# EAGLE design BDC-REV2 (EAGLE 9.6.2)
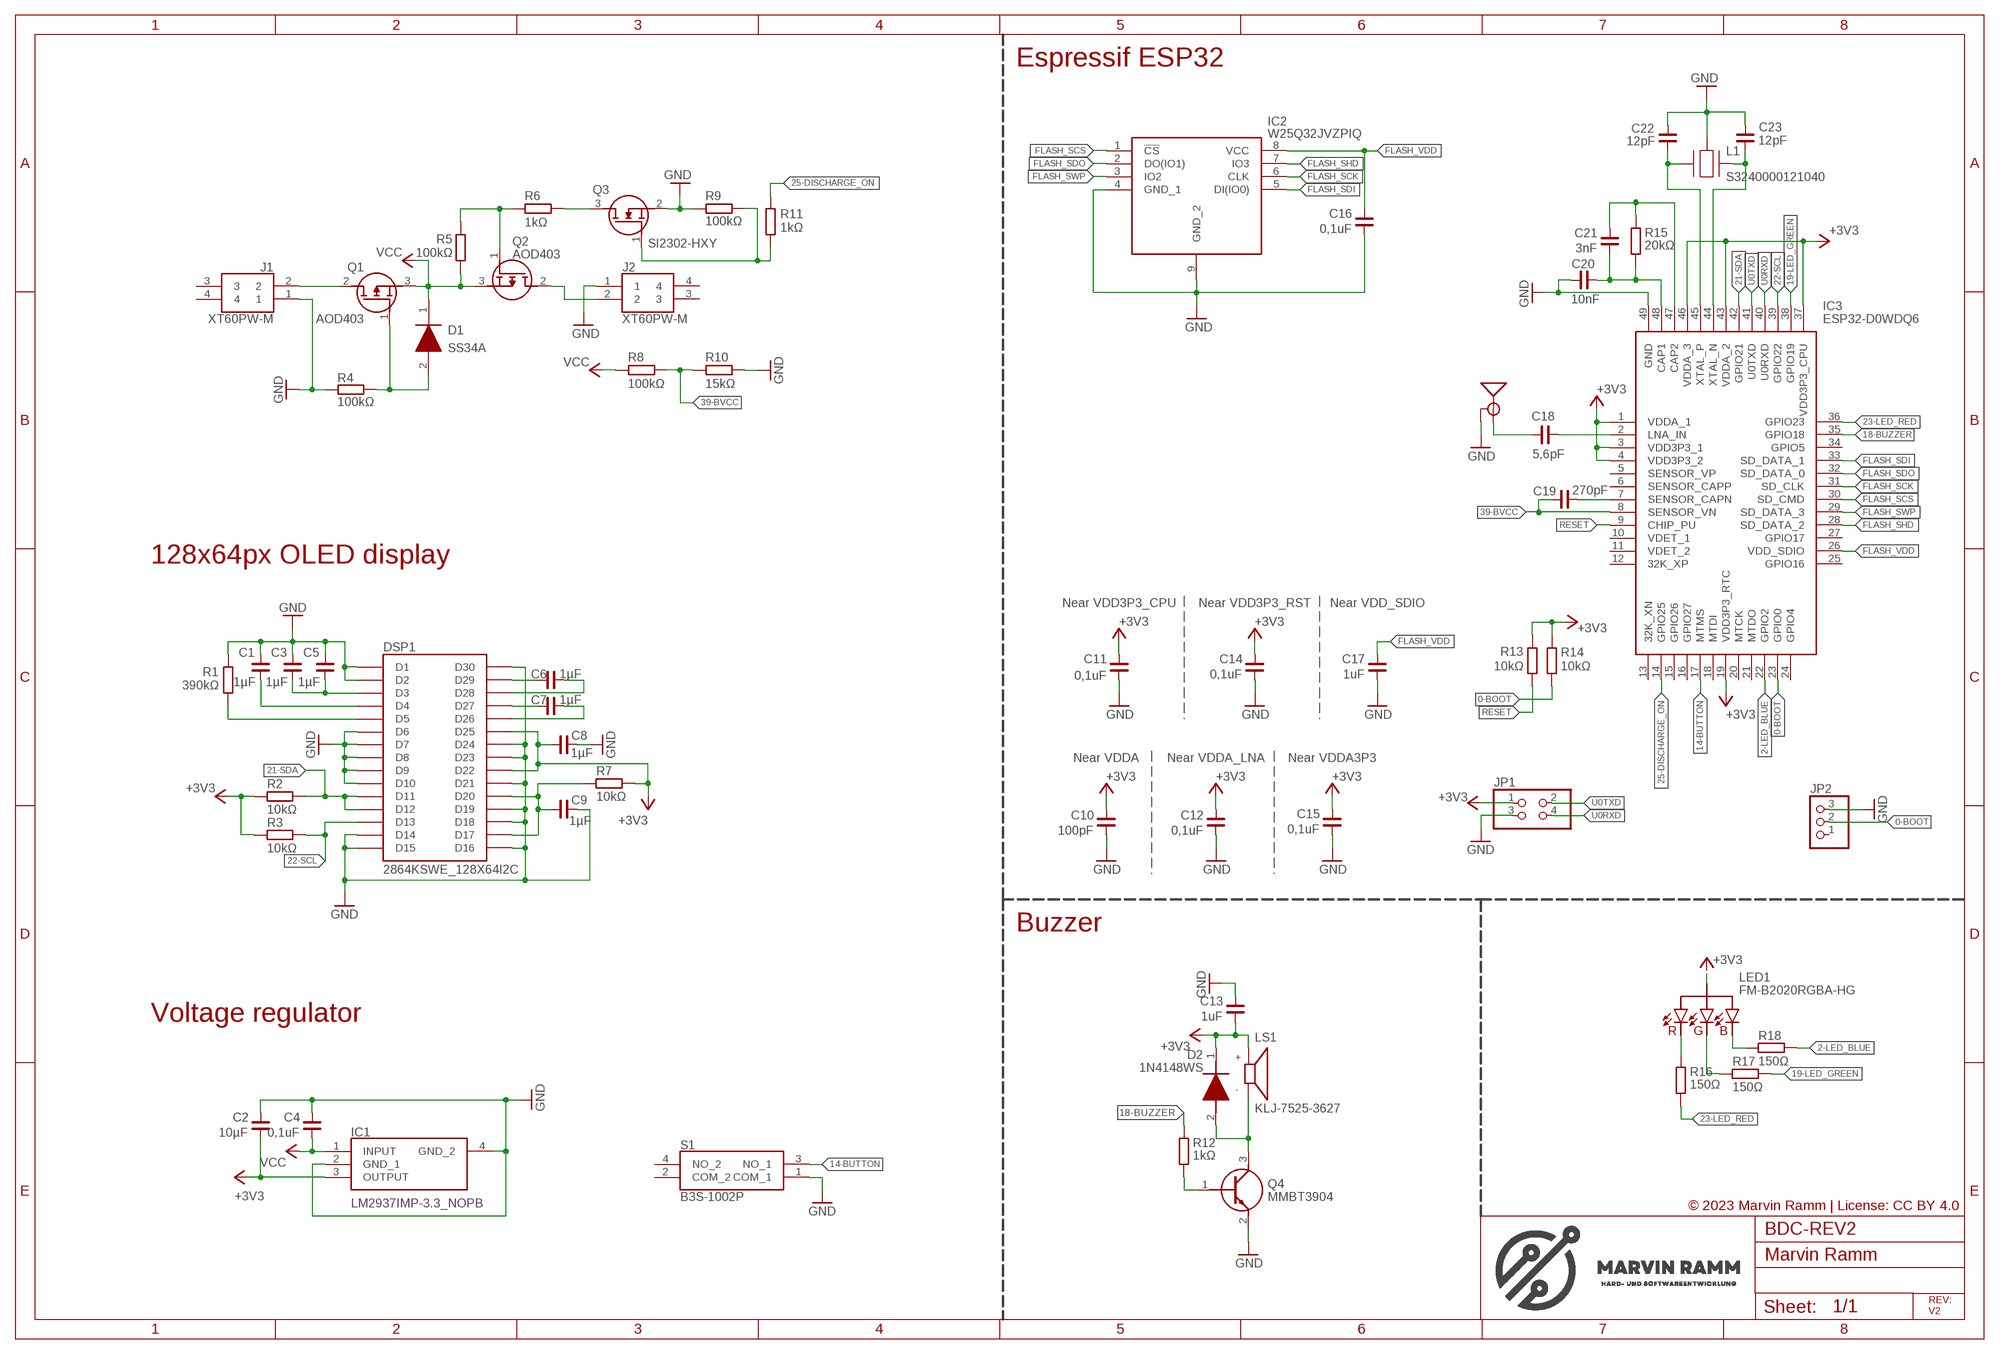
[diagram p0: schematic, sheet 1]

## Parts
C1  1µF  C_0402  [C0402]
C2  10µF  C_0603  [C0603]
C3  1µF  C_0402  [C0402]
C4  0,1uF  C_0402  [C0402]
C5  1µF  C_0402  [C0402]
C6  1µF  C_0402  [C0402]
C7  1µF  C_0402  [C0402]
C8  1µF  C_0402  [C0402]
C9  1µF  C_0402  [C0402]
C10  100pF  C_0402  [C0402]
C11  0,1uF  C_0402  [C0402]
C12  0,1uF  C_0402  [C0402]
C13  1uF  C_0402  [C0402]
C14  0,1uF  C_0402  [C0402]
C15  0,1uF  C_0402  [C0402]
C16  0,1uF  C_0402  [C0402]
C17  1uF  C_0402  [C0402]
C18  5,6pF  C_0402  [C0402]
C19  270pF  C_0402  [C0402]
C20  10nF  C_0402  [C0402]
C21  3nF  C_0402  [C0402]
C22  12pF  C_0402  [C0402]
C23  12pF  C_0402  [C0402]
D1  SS34A  [DIOM5026X262N]
D2  1N4148WS  [SODFL2512X90N]
DSP1  2864KSWE_128X64I2C  [2864KSWE_128X64I2C]
E1  ANTENNA-GROUNDEDTRACE-15.2MM  [TRACE_ANTENNA_2.4GHZ_15.2MM]
IC1  LM2937IMP-3.3_NOPB  [SOT230P700X180-4N]
IC2  W25Q128JVPIQ  [SON127P800X600X80-9N]
IC3  ESP32-D0WDQ6  [QFN40P600X600X90-49N]
J1  XT60PW-M  [XT60PWM]
J2  XT60PW-M  [XT60PWM]
JP1  PINHD-2X2  [2X02]
JP2  PINHD-1X3  [1X03]
L1  SMD-3225_4P16MHZ_20PF_10PPM_-4  [SMD3225_4P16MHZ20PF10PPM4085]
LED1  FM-B2020RGBA-HG  [FMB2020RGBAHG]
LS1  CMT-7525-80-SMT-TR  [XDCR_CMT-7525-80-SMT-TR]
Q1  AOD403  [AOD480]
Q2  AOD403  [AOD480]
Q3  SI2302DDS-T1-GE3  [SOT95P237X112-3N]
Q4  MMBT3904  [SOT95P240X120-3N]
R1  390kΩ  R_0402  [R0402]
R2  10kΩ  R_0402  [R0402]
R3  10kΩ  R_0402  [R0402]
R4  100kΩ  R_0402  [R0402]
R5  100kΩ  R_0402  [R0402]
R6  1kΩ  R_0402  [R0402]
R7  10kΩ  R_0402  [R0402]
R8  100kΩ  R_0402  [R0402]
R9  100kΩ  R_0402  [R0402]
R10  15kΩ  R_0402  [R0402]
R11  1kΩ  R_0402  [R0402]
R12  1kΩ  R_0402  [R0402]
R13  10kΩ  R_0402  [R0402]
R14  10kΩ  R_0402  [R0402]
R15  20kΩ  R_0402  [R0402]
R16  150Ω  R_0402  [R0402]
R17  150Ω  R_0402  [R0402]
R18  150Ω  R_0402  [R0402]
S1  B3S-1002P  [B3S1002P]

## Nets
0-BOOT: IC3.23(GPIO0) JP2.2 R14.2
2-LED_BLUE: IC3.22(GPIO2) R18.2
14-BUTTON: IC3.17(MTMS) S1.3(NO_1)
18-BUZZER: IC3.35(GPIO18) R12.1
19-LED_GREEN: IC3.38(GPIO19) R17.2
21-SDA: DSP1.D11 DSP1.D12 IC3.42(GPIO21) R2.2
22-SCL: DSP1.D13 IC3.39(GPIO22) R3.2
23-LED_RED: IC3.36(GPIO23) R16.2
25-DISCHARGE_ON: IC3.14(GPIO25) R11.1
39-BVCC: C19.1 IC3.8(SENSOR_VN) R8.1 R10.2
+3V3: C2.2 C8.1 C10.2 C11.2 C12.2 C13.1 C14.2 C15.2 D2.1(K) DSP1.D22 DSP1.D25 IC1.3(OUTPUT) IC3.1(VDDA_1) IC3.3(VDD3P3_1) IC3.4(VDD3P3_2) IC3.19(VDD3P3_RTC) IC3.37(VDD3P3_CPU) IC3.43(VDDA_2) IC3.46(VDDA_3) JP1.1 LED1.3(VCC) LS1.P R2.1 R3.1 R7.2 R13.2 R14.1
FLASH_SCK: IC2.6(CLK) IC3.31(SD_CLK)
FLASH_SCS: IC2.1(!CS) IC3.30(SD_CMD)
FLASH_SDI: IC2.5(DI(IO0)) IC3.33(SD_DATA_1)
FLASH_SDO: IC2.2(DO(IO1)) IC3.32(SD_DATA_0)
FLASH_SHD: IC2.7(IO3) IC3.28(SD_DATA_2)
FLASH_SWP: IC2.3(IO2) IC3.29(SD_DATA_3)
FLASH_VDD: C16.2 C17.2 IC2.8(VCC) IC3.26(VDD_SDIO)
GND: C1.1 C2.1 C3.1 C4.2 C5.1 C8.2 C9.2 C10.1 C11.1 C12.1 C13.2 C14.1 C15.1 C16.1 C17.1 C20.1 C22.1 C23.1 DSP1.D1 DSP1.D2 DSP1.D6 DSP1.D7 DSP1.D8 DSP1.D9 DSP1.D10 DSP1.D14 DSP1.D15 DSP1.D16 DSP1.D18 DSP1.D19 DSP1.D21 DSP1.D23 DSP1.D24 DSP1.D30 E1.GND IC1.2(GND_1) IC1.4(GND_2) IC2.4(GND_1) IC2.9(GND_2) IC3.49(GND) J1.1 J2.1 JP1.3 JP2.3 L1.2(GND_2) L1.4(GND_2) Q3.2(S) Q4.2(E) R1.2 R4.1 R9.2 R10.1 S1.1(COM_1)
N$1: C18.2 E1.ANT(SIGNAL)
N$2: Q2.1(G) R5.2 R6.2
N$3: J2.2 Q2.2(D)
N$5: Q3.3(D) R6.1
N$6: Q3.1(G) R9.1 R11.2
N$7: LED1.1(R) R16.1
N$8: LED1.2(B) R18.1
N$9: LED1.4(G) R17.1
N$10: J1.2 Q1.2(D)
N$15: D1.2(A) Q1.1(G) R4.2
N$23: C18.1 IC3.2(LNA_IN)
N$24: C20.2 C21.1 IC3.48(CAP1) R15.2
N$25: C21.2 IC3.47(CAP2) R15.1
N$26: C23.2 IC3.44(XTAL_N) L1.3(CRYSTAL_2)
N$27: C22.2 IC3.45(XTAL_P) L1.1(CRYSTAL_1)
N$28: C7.1 DSP1.D27
N$30: C9.1 DSP1.D17 DSP1.D20 R7.1
N$31: C1.2 DSP1.D4
N$32: C7.2 DSP1.D26
N$33: C3.2 C5.2 DSP1.D3
N$34: DSP1.D5 R1.1
N$35: C6.1 DSP1.D29
N$36: C6.2 DSP1.D28
N$39: C19.2 IC3.7(SENSOR_CAPN)
N$66: D2.2(A) LS1.N Q4.3(C)
N$69: Q4.1(B) R12.2
RESET: IC3.9(CHIP_PU) R13.1
U0RXD: IC3.40(U0RXD) JP1.4
U0TXD: IC3.41(U0TXD) JP1.2
VCC: C4.1 D1.1(K) IC1.1(INPUT) Q1.3(S) Q2.3(S) R5.1 R8.2
Unconnected: IC3.5(SENSOR_VP) IC3.6(SENSOR_CAPP) IC3.10(VDET_1) IC3.11(VDET_2) IC3.12(32K_XP) IC3.13(32K_XN) IC3.15(GPIO26) IC3.16(GPIO27) IC3.18(MTDI) IC3.20(MTCK) IC3.21(MTDO) IC3.24(GPIO4) IC3.25(GPIO16) IC3.27(GPIO17) IC3.34(GPIO5) J1.3 J1.4 J2.3 J2.4 JP2.1 S1.2(COM_2) S1.4(NO_2)

## Notes on the sheet
- Espressif ESP32
- W25Q32JVZPIQ
- S3240000121040
- SI2302-HXY
- 128x64px OLED display
- Near VDD3P3_CPU | Near VDD3P3_RST | Near VDD_SDIO
- Near VDDA | Near VDDA_LNA | Near VDDA3P3
- Buzzer
- Voltage regulator
- KLJ-7525-3627
- © 2023 Marvin Ramm | License: CC BY 4.0
- Marvin Ramm
- REV:
  V2

## Library data of the parts
C1-C23 = rc-master-smd:C_: NON-POLARIZED CAP
D1 = SS34A:SS34A: MULTICOMP - SS34A - DIODE, RECTIFIER, 3A, 40V, DO-214AC Source: Datasheet <https://componentsearchengine.com/Datasheets/2/SS34A.pdf>; DESCRIPTION: MULTICOMP - SS34A - DIODE, RECTIFIER, 3A, 40V, DO-214AC; HEIGHT: 2.62mm; MANUFACTURER_NAME: MULTICOMP; MANUFACTURER_PART_NUMBER: SS34A
D2 = 1N4148WS:1N4148WS: ON Semiconductor Switching Diode, 300mA 75V, 2-Pin SOD-323 1N4148WS Source: Datasheet; ARROW_PART_NUMBER: 1N4148WS; ARROW_PRICE-STOCK: https://www.arrow.com/en/products/1n4148ws/on-semiconductor?region=asia; DESCRIPTION: ON Semiconductor Switching Diode, 300mA 75V, 2-Pin SOD-323 1N4148WS; HEIGHT: 0.9mm; MANUFACTURER_NAME: onsemi; MANUFACTURER_PART_NUMBER: 1N4148WS; MOUSER_PART_NUMBER: 512-1N4148WS; MOUSER_PRICE-STOCK: https://www.mouser.co.uk/ProductDetail/ON-Semiconductor-Fairchild/1N4148WS?qs=2%2FYqgE%252BHg%252BKBrKZlAsMLhw%3D%3D
DSP1 = 2864KSWE_128X64I2C:2864KSWE_128X64I2C
E1 = SparkFun-RF:ANTENNA-GROUNDED: Antenna w/ Ground Connection 2.4GHz antennae with signal and ground terminals. TRACE_ANTENNA_2.4GHZ_15.2MM - Meander Trace antenna 15.2 x 5.7mm footprint Based on layout from TI app note AN043 <http://www.ti.com/lit/an/swra117d/swra117d.pdf>. TRACE_ANTENNA_2.4GHZ_25.7MM - Inverted F trace antenna 25.7 x 7.5 mm footprint. Based on layout from TI design note DN0007 <http://www.ti.com/lit/an/swru120b/swru120b.pdf>.
IC1 = LM2937IMP-3.3_NOPB:LM2937IMP-3.3_NOPB: LM2937 2.5-V and 3.3-V 400-mA and 500-mA Voltage Regulators Source: Datasheet <https://www.ti.com/lit/ds/symlink/lm2937.pdf?ts=1607582693087&ref_url=https%3A%2F%2Fwww.ti.com%2Fsitesearch%2Fdocs%2Funiversalsearch.tsp%3FsearchTerm%3DLM2937IMP-3.3%2FNOPB>; ARROW_PART_NUMBER: LM2937IMP-3.3/NOPB; ARROW_PRICE-STOCK: https://www.arrow.com/en/products/lm2937imp-3.3nopb/texas-instruments?region=nac; DESCRIPTION: LM2937 2.5-V and 3.3-V 400-mA and 500-mA Voltage Regulators; HEIGHT: 1.8mm; MANUFACTURER_NAME: Texas Instruments; MANUFACTURER_PART_NUMBER: LM2937IMP-3.3/NOPB; MOUSER_PART_NUMBER: 926-LM2937IMP3.3NOPB; MOUSER_PRICE-STOCK: https://www.mouser.co.uk/ProductDetail/Texas-Instruments/LM2937IMP-3.3-NOPB?qs=X1J7HmVL2ZFVwNOBcwuxRQ%3D%3D
IC2 = W25Q128JVPIQ:W25Q128JVPIQ: IC FLASH 128M SPI 133MHZ 8WSON Source: Datasheet <https://www.arrow.com/en/products/w25q128jvpiq/winbond-electronics>; ARROW_PART_NUMBER: W25Q128JVPIQ; ARROW_PRICE-STOCK: https://www.arrow.com/en/products/w25q128jvpiq/winbond-electronics?region=nac; DESCRIPTION: IC FLASH 128M SPI 133MHZ 8WSON; HEIGHT: 0.8mm; MANUFACTURER_NAME: Winbond; MANUFACTURER_PART_NUMBER: W25Q128JVPIQ; MOUSER_PART_NUMBER: 454-W25Q128JVPIQ; MOUSER_PRICE-STOCK: https://www.mouser.co.uk/ProductDetail/Winbond/W25Q128JVPIQ?qs=qSfuJ%252Bfl%2Fd676hAD%252B1JSfw%3D%3D
IC3 = ESP32-D0WDQ6:ESP32-D0WDQ6: RF System on a Chip - SoC SMD IC ESP32-D0WDQ6, Dual Core MCU, WiFi & Bluetooth Combo, QFN48-pin, 6*6mm Source: Datasheet <https://www.espressif.com/sites/default/files/documentation/esp32_datasheet_en.pdf>; DESCRIPTION: RF System on a Chip - SoC SMD IC ESP32-D0WDQ6, Dual Core MCU, WiFi & Bluetooth Combo, QFN48-pin, 6*6mm; HEIGHT: 0.9mm; MANUFACTURER_NAME: Espressif Systems; MANUFACTURER_PART_NUMBER: ESP32-D0WDQ6; MOUSER_PART_NUMBER: 356-ESP32-D0WDQ6; MOUSER_PRICE-STOCK: https://www.mouser.co.uk/ProductDetail/Espressif-Systems/ESP32-D0WDQ6?qs=chTDxNqvsykWgzfXx0gR%252BQ%3D%3D
J1 J2 = XT60PW-M:XT60PW-M: Socket; DC supply; XT60; male; PIN: 2; on PCBs; THT; Colour: yellow Source: Datasheet <https://www.tme.eu/Document/9b8d0c5eb7094295f3d3112c214d3ade/XT60PW SPEC.pdf>; DESCRIPTION: Socket; DC supply; XT60; male; PIN: 2; on PCBs; THT; Colour: yellow; HEIGHT: 8.4mm; MANUFACTURER_NAME: Changzou Amass Elec; MANUFACTURER_PART_NUMBER: XT60PW-M; SPICEPREFIX: E
JP1 = pinhead2:PINHD-2X2: PIN HEADER
JP2 = pinhead2:PINHD-1X3: PIN HEADER
L1 = SMD-3225_4P16MHZ_20PF_10PPM_-4:SMD-3225_4P16MHZ_20PF_10PPM_-4: SMD-3225_4P16MHZ 20PF 10PPM -40~+85 Source: Datasheet <https://datasheet.lcsc.com/szlcsc/Zhejiang-Abel-Elec-SMD-3225-4P-16MHz-20pF-10ppm-40-85_C164049.pdf>; DESCRIPTION: SMD-3225_4P16MHZ 20PF 10PPM -40~+85; HEIGHT: 0.8mm; MANUFACTURER_NAME: TAE(Zhejiang Abel Elec); MANUFACTURER_PART_NUMBER: SMD-3225_4P16MHZ 20PF 10PPM -40~+85℃
LED1 = FM-B2020RGBA-HG:FM-B2020RGBA-HG: Light Emitting Diodes (LED) RGB 615~630nm Red, 515~535nm Green, 465~480nm Blue 35~85mcd@8mARed,100~260mcd@5mAGreen,15~40mcd@3mABlue Top View 2020 RoHS Source: Datasheet <https://datasheet.lcsc.com/szlcsc/Foshan-NationStar-Optoelectronics-FM-B2020RGBA-HG_C108793.pdf>
LS1 = CMT-7525-80-SMT-TR:CMT-7525-80-SMT-TR: CMT-7525-80-SMT-TR Check prices <https://pricing.snapeda.com/parts/CMT-7525-80-SMT-TR/CUI%20Devices/view-part?ref=eda>; AVAILABILITY: Good; CUI_PURCHASE_URL: https://www.cuidevices.com/product/audio/buzzers/audio-transducers/cmt-7525-80-smt-tr?utm_source=snapeda.com&utm_medium=referral&utm_campaign=snapedaBOM; DESCRIPTION: 7.5 mm, 3.6 Vo-p, 80 dB, Surface Mount (SMT), Magnetic Audio Transducer Buzzer; MF: CUI Devices; MP: CMT-7525-80-SMT-TR; PACKAGE: CUI Devices; PRICE: None; PURCHASE-URL: https://pricing.snapeda.com/search/part/CMT-7525-80-SMT-TR/?ref=eda
Q1 Q2 = AOD403:AOD403: MOSFET P-CH 30V 15A TO252 Source: Datasheet <http://aosmd.com/res/data_sheets/AOD403.pdf>; ARROW_PART_NUMBER: AOD403; ARROW_PRICE-STOCK: https://www.arrow.com/en/products/aod403/alpha-and-omega-semiconductor?region=nac; DESCRIPTION: MOSFET P-CH 30V 15A TO252; HEIGHT: 2mm; MANUFACTURER_NAME: Alpha & Omega Semiconductors; MANUFACTURER_PART_NUMBER: AOD403
Q3 = SI2302DDS-T1-GE3:SI2302DDS-T1-GE3: SI2302DDS-T1-GE3 N-Channel MOSFET, 2.6 A, 20 V, 3-Pin SOT-363 Vishay Source: Datasheet <http://www.vishay.com/docs/63653/si2302dds.pdf>; ARROW_PART_NUMBER: SI2302DDS-T1-GE3; ARROW_PRICE-STOCK: https://www.arrow.com/en/products/si2302dds-t1-ge3/vishay; DESCRIPTION: SI2302DDS-T1-GE3 N-Channel MOSFET, 2.6 A, 20 V, 3-Pin SOT-363 Vishay; HEIGHT: 1.12mm; MANUFACTURER_NAME: Vishay; MANUFACTURER_PART_NUMBER: SI2302DDS-T1-GE3; MOUSER_PART_NUMBER: 78-SI2302DDS-T1-GE3; MOUSER_PRICE-STOCK: https://www.mouser.co.uk/ProductDetail/Vishay-Semiconductors/SI2302DDS-T1-GE3?qs=MxnWX8BLHKdaCSNWhg%252BxLA%3D%3D
Q4 = MMBT3904:MMBT3904: Transistor GP BJT NPN 40V 0.2A SOT23 Fairchild MMBT3904 NPN Bipolar Transistor, 0.2 A, 40 V, 3-Pin SOT-23 Source: Datasheet <https://media.digikey.com/pdf/Data Sheets/ON Semiconductor PDFs/2N3904,MMBT3904,PZT3904.pdf>; ARROW_PART_NUMBER: MMBT3904; ARROW_PRICE-STOCK: https://www.arrow.com/en/products/mmbt3904/on-semiconductor; DESCRIPTION: Transistor GP BJT NPN 40V 0.2A SOT23 Fairchild MMBT3904 NPN Bipolar Transistor, 0.2 A, 40 V, 3-Pin SOT-23; HEIGHT: 1.2mm; MANUFACTURER_NAME: ON Semiconductor; MANUFACTURER_PART_NUMBER: MMBT3904; MOUSER_PART_NUMBER: 512-MMBT3904; MOUSER_PRICE-STOCK: https://www.mouser.co.uk/ProductDetail/ON-Semiconductor-Fairchild/MMBT3904?qs=UMEuL5FsraCg3xKjS4uBJQ%3D%3D
R1-R18 = rc-master-smd:R_: RESISTOR
S1 = B3S-1002P:B3S-1002P: OMRON ELECTRONIC COMPONENTS - B3S-1002P - SWITCH, TACTILE, SPST-NO, 50mA, SMD, FULL REEL Source: Datasheet <https://componentsearchengine.com/Datasheets/1/B3S-1002P.pdf>; ARROW_PART_NUMBER: B3S-1002P; ARROW_PRICE-STOCK: https://www.arrow.com/en/products/b3s1002p/omron; DESCRIPTION: OMRON ELECTRONIC COMPONENTS - B3S-1002P - SWITCH, TACTILE, SPST-NO, 50mA, SMD, FULL REEL; HEIGHT: 4.3mm; MANUFACTURER_NAME: Omron Electronics; MANUFACTURER_PART_NUMBER: B3S-1002P; MOUSER_PART_NUMBER: 653-B3S-1002P; MOUSER_PRICE-STOCK: https://www.mouser.co.uk/ProductDetail/Omron-Electronics/B3S-1002P?qs=VO24nqdQNUCtpi6pYm2hHQ%3D%3D

## Board
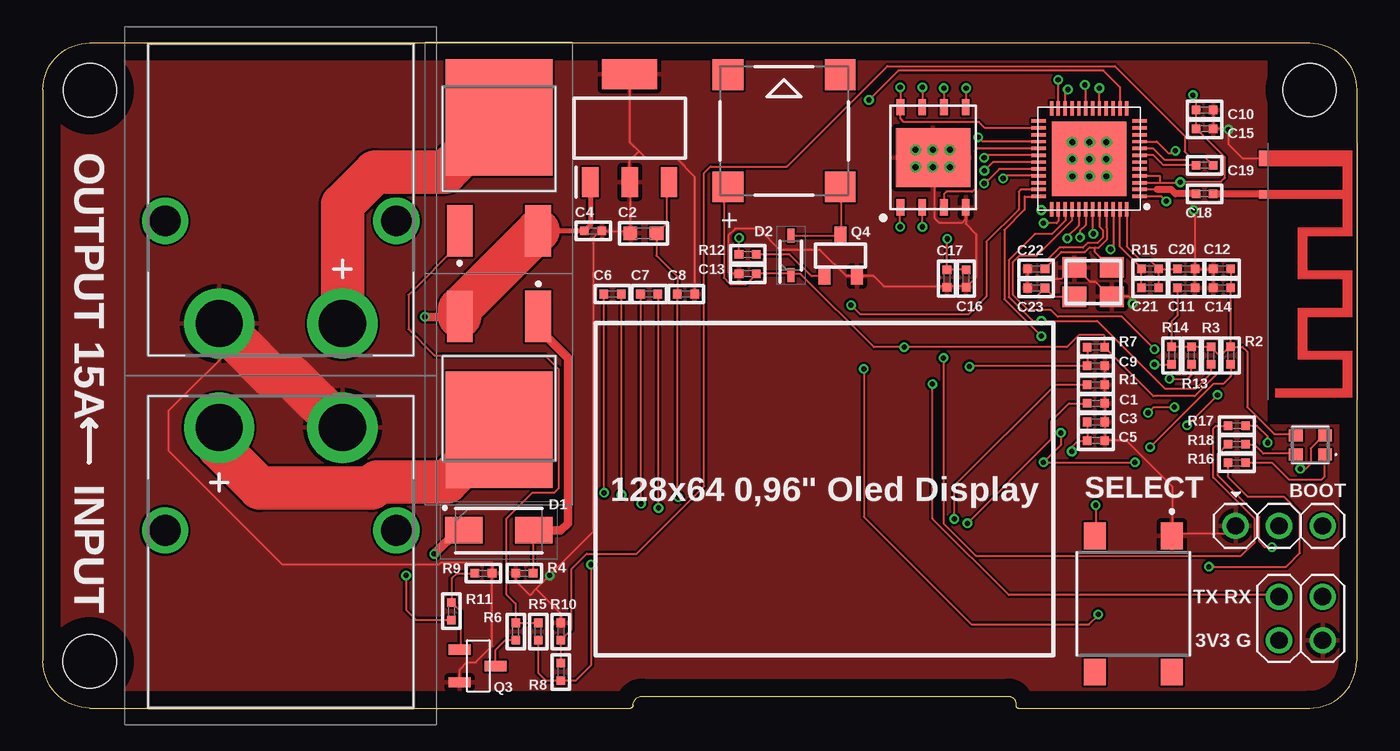
[diagram p1: board, top side]
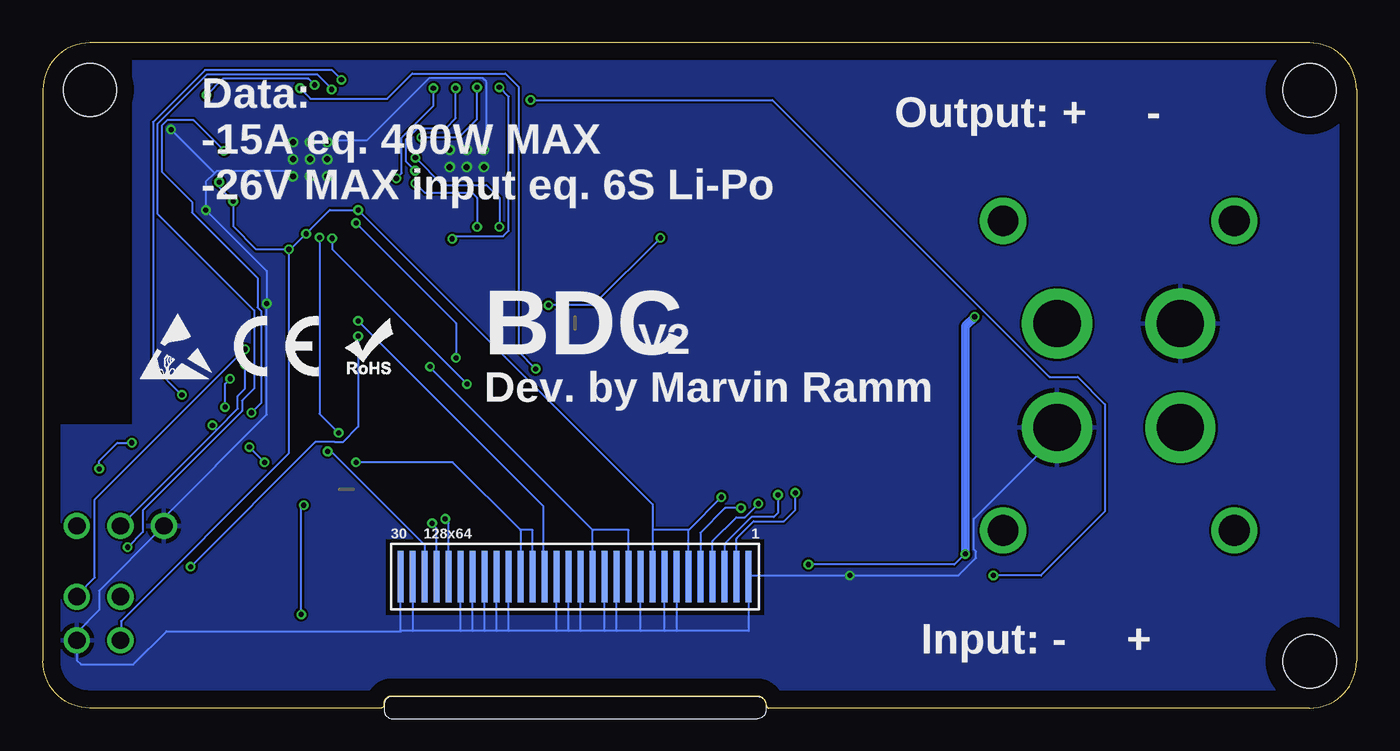
[diagram p2: board, bottom side, seen from below]

Size 76.7 x 38.85 mm. Coordinates in mm from the lower left corner, seen from the top.
Outline: 2.75,0 34.3,0 arc90 34.45,0.15 arc-90 35,0.7 56.35,0.7 arc-90 56.8,0.25 56.8,0.15 arc90 56.95,0 73.95,0 arc90 76.7,2.75 76.7,36.1 arc90 73.95,38.85 2.75,38.85 arc90 0,36.1 0,2.75 arc90 2.75,0
Copper layers (1*16): Top 0.035mm / dielectric 1.53mm / Bottom 0.035mm
Design rules "JLCPCB_1-2layer": minimum track width 5mil, minimum drill 0.3mm, track to track 5mil, track to pad 0.2mm, pad to pad 7mil, via to via 7mil, smd to smd 7mil, copper to edge 40mil, drill to drill 6mil, minimum pad ring 6mil, minimum via ring 0.13mm, stop-mask expansion 0.1mm, vias tented up to drill 20mil, thermal gap 10mil
Holes 3.1 mm at 2.75,36.09 2.74,2.74 73.95,36.1
tRestrict: area 71.5,16.6 to 76.7,38.9; area 58,29.1 to 64.2,35.1
bRestrict: area 71.5,16.6 to 76.7,38.9; area 34.6,5.5 to 56.6,9.8

### Footprints (pad centres in the part's own frame; a part is rotated, then mirrored left to right if it is on the bottom)
C0402 = smd 0.5 x 0.5: 1 -0.508,0; 2 0.508,0
C0603 = smd 0.8 x 0.8: 1 -0.762,0; 2 0.762,0
DIOM5026X262N = smd 2.2 x 1.55: 1 -2.05,0; 2 2.05,0
SODFL2512X90N = smd 0.82 x 0.42: 1 -1.15,0; 2 1.15,0
2864KSWE_128X64I2C = smd 0.35 x 3: D1 0.175,1.5; D2 0.875,1.5; D3 1.575,1.5; D4 2.275,1.5; D5 2.975,1.5; D6 3.675,1.5; D7 4.375,1.5; D8 5.075,1.5; D9 5.775,1.5; D10 6.475,1.5; D11 7.175,1.5; D12 7.875,1.5; D13 8.575,1.5; D14 9.275,1.5; D15 9.975,1.5; D16 10.675,1.5; D17 11.375,1.5; D18 12.075,1.5; D19 12.775,1.5; D20 13.475,1.5; D21 14.175,1.5; D22 14.875,1.5; D23 15.575,1.5; D24 16.275,1.5; D25 16.975,1.5; D26 17.675,1.5; D27 18.375,1.5; D28 19.075,1.5; D29 19.775,1.5; D30 20.475,1.5
TRACE_ANTENNA_2.4GHZ_15.2MM = smd 0.5 x 0.5: ANT 0,-0.25 | smd 0.9 x 0.5: GND -2.1,-0.25
SOT230P700X180-4N = smd 1.75 x 0.95: 1 -3.15,2.3; 2 -3.15,0; 3 -3.15,-2.3 | smd 1.75 x 3.2: 4 3.15,0
SON127P800X600X80-9N = smd 0.95 x 0.45: 1 -2.85,1.905; 2 -2.85,0.635; 3 -2.85,-0.635; 4 -2.85,-1.905; 5 3,-1.905; 6 3,-0.635; 7 3,0.635; 8 3,1.905 | smd 3.45 x 4.35: 9 0.05,0
QFN40P600X600X90-49N = smd 0.85 x 0.2: 1 -2.95,2.2; 2 -2.95,1.8; 3 -2.95,1.4; 4 -2.95,1; 5 -2.95,0.6; 6 -2.95,0.2; 7 -2.95,-0.2; 8 -2.95,-0.6; 9 -2.95,-1; 10 -2.95,-1.4; 11 -2.95,-1.8; 12 -2.95,-2.2; 25 2.95,-2.2; 26 2.95,-1.8; 27 2.95,-1.4; 28 2.95,-1; 29 2.95,-0.6; 30 2.95,-0.2; 31 2.95,0.2; 32 2.95,0.6; 33 2.95,1; 34 2.95,1.4; 35 2.95,1.8; 36 2.95,2.2 | smd 0.2 x 0.85: 13 -2.2,-2.95; 14 -1.8,-2.95; 15 -1.4,-2.95; 16 -1,-2.95; 17 -0.6,-2.95; 18 -0.2,-2.95; 19 0.2,-2.95; 20 0.6,-2.95; 21 1,-2.95; 22 1.4,-2.95; 23 1.8,-2.95; 24 2.2,-2.95; 37 2.2,2.95; 38 1.8,2.95; 39 1.4,2.95; 40 1,2.95; 41 0.6,2.95; 42 0.2,2.95; 43 -0.2,2.95; 44 -0.6,2.95; 45 -1,2.95; 46 -1.4,2.95; 47 -1.8,2.95; 48 -2.2,2.95 | smd 4.35 x 4.35: 49 0,0
XT60PWM = drill 2.75 pad 4.1: 1 -3.6,0; 2 3.6,0 | drill 1.8 pad 2.7: 3 6.75,6; 4 -6.75,6
2X02 = drill 1.016: 1 -1.27,-1.27; 2 -1.27,1.27; 3 1.27,-1.27; 4 1.27,1.27
1X03 = drill 1.016: 1 -2.54,0; 2 0,0; 3 2.54,0
SMD3225_4P16MHZ20PF10PPM4085 = smd 1.4 x 1.2: 1 -1.1,-0.85; 2 1.1,-0.85; 3 1.1,0.85; 4 -1.1,0.85
FMB2020RGBAHG = smd 0.8 x 0.7: 1 0.85,-0.55; 2 -0.85,-0.55; 3 -0.85,0.55; 4 0.85,0.55
XDCR_CMT-7525-80-SMT-TR = smd 1.8 x 1.8: 1 3.275,3.275; 2 3.275,-3.275; N -3.275,-3.275; P -3.275,3.275
AOD480 = smd 1.5 x 3: 1 -2.286,-8.4; 3 2.286,-8.4 | smd 6.25 x 6.8: 2 0,-1.8
SOT95P237X112-3N = smd 1.3 x 0.6: 1 -1.05,0.95; 2 -1.05,-0.95; 3 1.05,0
SOT95P240X120-3N = smd 1 x 0.7: 1 -1.2,0.95; 2 -1.2,-0.95; 3 1.2,0
R0402 = smd 0.5 x 0.5: 1 -0.508,0; 2 0.508,0
B3S1002P = smd 1.55 x 1.3: 1 3.975,-2.25; 2 -3.975,-2.25; 3 3.975,2.25; 4 -3.975,2.25

### Placement (x,y rotation side)
C1  61.48,17.8 180 top
C2  35.06,27.73 0 top
C3  61.48,16.71 180 top
C4  32.13,27.86 0 top
C5  61.48,15.62 180 top
C6  33.26,24.18 0 top
C7  35.4,24.18 0 top
C8  37.54,24.18 0 top
C9  61.48,19.98 0 top
C10  67.82,34.92 180 top
C11  66.75,24.54 180 top
C12  68.84,25.65 0 top
C13  41.15,25.37 180 top
C14  68.84,24.54 0 top
C15  67.82,33.83 180 top
C16  53.89,25.09 90 top
C17  52.78,25.09 90 top
C18  67.82,30.03 0 top
C19  67.82,31.7 180 top
C20  66.75,25.65 180 top
C21  64.64,24.54 180 top
C22  57.99,25.64 0 top
C23  57.99,24.53 0 top
D1  26.62,10.38 0 top
D2  43.67,26.43 90 top
DSP1  55.98,6.18 0 bottom
E1  71.52,30 270 top
IC1  34.26,33.87 90 top
IC2  51.97,32.09 90 top
IC3  61.08,32.08 180 top
J1  13.89,16.38 180 top
J2  13.89,22.45 0 top
JP1  73.44,5.23 0 top
JP2  72.17,10.64 180 top
L1  61.32,24.88 180 top
LED1  74,15.36 0 top
LS1  43.27,33.71 90 top
Q1  26.63,14.47 180 top
Q2  26.63,36.28 0 top
Q3  25.38,2.46 0 top
Q4  46.57,26.42 90 top
R1  61.48,18.88 0 top
R2  69.34,20.59 270 top
R3  68.19,20.59 270 top
R4  28.11,7.88 0 top
R5  28.92,4.47 90 top
R6  27.61,4.47 90 top
R7  61.48,21.08 0 top
R8  30.24,2.11 270 top
R9  25.72,7.88 0 top
R10  30.24,4.47 270 top
R11  23.86,5.66 90 top
R12  41.15,26.49 0 top
R13  67.05,20.59 90 top
R14  65.9,20.59 270 top
R15  64.64,25.65 0 top
R16  69.7,14.32 180 top
R17  69.7,16.49 180 top
R18  69.7,15.41 180 top
S1  63.66,6.08 90 top

### Tracks (layer width: path | path; a pad name or v marks a point on that pad's centre or on a via)
0-BOOT  (via drill 0.3)
  Top 0.127: v64.9,20.07 65.79,20.07 R14.2 | v66.8,16.51 v68.58,18.29 | 59.31,35.05 IC3.23 v59.28,36.68 v59.27,36.69
  Bottom 0.127: 66.55,16.26 72.14,10.67 JP2.2 | 66.55,16.26 v66.8,16.51 | v68.58,18.29 70.27,19.97 70.27,34.22 67.23,37.25 59.82,37.25 v59.27,36.7 v59.27,36.69 | 66.55,16.26 65.32,17.49 65.32,18.23 64.9,18.65 v64.9,20.07
2-LED_BLUE  (via drill 0.3)
  Top 0.127: v71.75,9.4 71.34,9.4 71.02,9.72 71.02,11.15 68.58,13.59 68.58,14.81 69.13,15.36 69.13,15.38 R18.2 | 59.69,35.05 IC3.22 59.68,35.97 v59.84,36.13
  Bottom 0.127: v71.75,9.4 70.87,10.28 70.87,11.55 65.06,17.36 65.06,17.95 64.35,18.66 64.35,23.22 70.01,28.88 70.01,34.11 67.13,37 60.67,37 59.84,36.17 v59.84,36.13
14-BUTTON  (via drill 0.3)
  Top 0.127: IC3.17 v61.68,36.2 | v47.93,19.81 47.93,11.17 54.21,4.89 61.07,4.89 61.61,5.43 v61.61,5.47 | v61.47,11.85 61.47,10.12 S1.3
  Bottom 0.127: v61.68,36.2 61.07,35.59 56.59,35.59 55.13,37.05 49.69,37.05 48.94,36.3 48.94,20.82 v47.93,19.81 | v61.61,5.47 61.61,11.71 v61.47,11.85
18-BUZZER  (via drill 0.3)
  Top 0.127: IC3.35 57.1,30.28 56.97,30.16 56.97,29.12 55.08,27.23 55.08,24.04 54.03,22.99 47.72,22.99 v47.18,23.53 | R12.1 v40.64,27.45 v40.65,27.46
  Bottom 0.127: v40.65,27.46 44.58,23.53 v47.18,23.53
19-LED_GREEN  (via drill 0.3)
  Top 0.127: v52.58,20.45 52.58,10.79 54.48,8.89 69.94,8.89 70.74,9.69 70.74,11.05 68.33,13.46 68.33,16.32 68.49,16.48 R17.2 | v58.42,28.32 59.17,28.32 59.28,28.43 IC3.38
  Bottom 0.127: v52.58,20.45 52.58,22.48 v58.42,28.32
21-SDA  (via drill 0.3)
  Top 0.127: v63.75,14.35 v58.42,14.35 59.43,15.36 v59.43,16.07 | R2.2 69.34,19.37 68.9,18.93 68.34,18.93 v64.65,15.24 v64.64,15.24 | IC3.42 60.88,28.21 60.55,27.87 v60.55,27.48
  Bottom 0.127: DSP1.D12 48.1,10.4 48.77,10.4 48.8,10.4 | 48.8,10.4 DSP1.D11 | 48.8,10.4 48.82,10.4 52.77,14.35 v58.42,14.35 | v63.75,14.35 v64.64,15.24 | v60.55,27.48 60.55,17.19 v59.43,16.07
22-SCL  (via drill 0.3)
  Top 0.127: R3.2 68.19,19.54 67.32,18.67 65.49,18.67 61.56,22.61 v58.29,22.61 57.78,22.61 56.39,24 56.39,26.16 57.91,27.69 58.9,27.69 59.68,28.46 IC3.39
  Bottom 0.127: v58.29,22.61 47.5,11.81 47.5,7.75 DSP1.D13
23-LED_RED  (via drill 0.3)
  Top 0.127: v68.07,8.26 72.59,8.26 73.39,9.05 73.39,11.41 72.46,12.33 70.33,12.33 69.19,13.48 R16.2 | v58.29,21.72 56.13,23.88 56.13,27.93 57.31,29.11 57.31,29.88 IC3.36
  Bottom 0.127: v68.07,8.26 60.8,15.53 59.66,15.53 59.2,15.53 58.29,16.44 v58.29,21.72
25-DISCHARGE_ON  (via drill 0.3)
  Top 0.127: v21.21,7.75 21.21,5.73 21.79,5.15 R11.1 | v48.23,35.51 49.95,37.23 61.91,37.23 62.88,36.26 IC3.14
  Bottom 0.127: v21.21,7.75 18.43,7.75 14.69,11.49 14.69,17.74 16.29,19.34 17.94,19.34 34.12,35.51 v48.23,35.51
39-BVCC
  Top 0.127: R8.1 R10.2 30.35,4.06 30.86,4.57 30.86,8.13 31.75,9.02 34.67,9.02 38.61,12.95 38.61,31.24 38.99,31.62 43.43,31.62 49.3,37.49 62.59,37.49 66.66,33.41 66.66,32.5 66.95,32.21 | 68.33,31.75 C19.1 67.81,32.21 66.95,32.21 | 66.95,32.21 66.74,32 65.5,32 64.82,32.68 IC3.8
+3V3  (via drill 0.3)
  Top 0.127: IC3.3 65.2,30.68 | 65.2,30.68 66.37,30.68 v66.4,30.71 66.42,30.73 68.78,30.73 69.01,30.97 69.01,32.16 67.47,33.71 67.47,33.77 C15.2 67.31,33.91 67.31,34.8 C10.2 67.31,35.63 v67.14,35.8 | v65.59,29.6 65.3,29.88 IC3.1 | IC3.46 62.48,26.93 v62.34,26.79 | LS1.P 39.88,30.35 39.75,30.23 39.75,25.13 40.12,24.77 41.07,24.77 41.66,25.36 C13.1 43.59,25.37 D2.1 43.74,25.35 44.24,25.35 48.51,21.08 v50.29,21.08 59.78,21.08 60.49,21.79 61.93,21.79 61.99,21.73 R7.2 61.99,21.05 64.82,18.22 67.24,18.22 68.71,19.68 68.71,20.52 | 65.91,21.08 66.93,21.08 R13.2 67.06,21.08 68.07,21.08 R3.1 68.2,21.08 68.71,20.57 68.71,20.52 | 65.91,21.08 65.89,21.08 65.89,22.56 66.24,22.91 C11.2 | 65.91,21.08 R14.1 | C12.2 C14.2 69.34,24.51 69.34,21.21 R2.1 | 68.71,20.52 69.27,21.09 R2.1 | R2.1 70.03,21.1 70.31,20.82 70.31,17.58 71.88,16 73.03,16 LED1.3 | IC1.3 36.45,30.61 36.45,28.32 35.94,27.81 C2.2 35.82,26.41 37.04,25.2 C8.1 37.03,24.11 37.03,12.37 v37.08,12.32 | v58.29,29.08 58.8,29.08 IC3.37 | IC3.19 60.88,36.34 v60.83,36.39 | IC3.43 61.28,27.75 v61.33,27.7 | IC3.4 65.2,31.08 65.2,30.68
  Bottom 0.127: DSP1.D25 39.01,10.4 | 41.1,10.4 DSP1.D22 | 39.01,10.4 41.1,10.4 | v66.4,30.71 66.4,30.41 v65.59,29.6 65.59,28.14 64.24,26.79 v62.34,26.79 | v37.08,12.32 38.99,10.41 39.01,10.4 | v62.34,26.79 62.23,26.8 v61.33,27.7 59.94,29.08 v58.29,29.08 v50.29,21.08 41.1,11.89 41.1,10.4 | JP1.1 72.14,4.06 72.14,5.08 62.36,14.86 62.36,26.67 v62.34,26.79 | v67.14,35.8 66.2,36.74 61.2,36.74 60.84,36.39 v60.83,36.39
FLASH_SCK  (via drill 0.3)
  Top 0.127: IC3.31 55.46,31.88 v54.97,31.38 | v52.6,36.2 IC2.6
  Bottom 0.127: v54.97,31.38 55.49,31.91 55.49,33.21 54.83,33.88 53.17,33.88 52.6,34.45 v52.6,36.2
FLASH_SCS  (via drill 0.3)
  Top 0.127: IC3.30 55.1,32.28 v54.95,32.14 | v50.05,28.1 50.05,29.23 IC2.1
  Bottom 0.127: v54.95,32.14 53.37,30.55 50.8,30.55 50.05,29.8 v50.05,28.1
FLASH_SDI  (via drill 0.3)
  Top 0.127: IC3.33 56.2,31.08 v56.06,30.94 | v53.9,36.2 53.9,35.12 IC2.5
  Bottom 0.127: v56.06,30.94 55.75,31.25 55.75,33.32 53.9,35.17 v53.9,36.2
FLASH_SDO  (via drill 0.3)
  Top 0.127: v54.95,30.64 55.15,30.84 55.19,30.84 55.83,31.48 IC3.32 | v51.35,28.1 51.34,28.11 IC2.2
  Bottom 0.127: v54.95,30.64 54.41,30.1 51.65,30.1 51.35,29.8 v51.35,28.1
FLASH_SHD  (via drill 0.3)
  Top 0.127: IC3.28 54.86,33.08 v54.6,33.34 | v51.35,36.25 51.35,35.1 IC2.7
  Bottom 0.127: v54.6,33.34 52.41,33.34 51.35,34.4 v51.35,36.25
FLASH_SWP
  Top 0.127: IC3.29 54.54,32.68 54.41,32.55 54.41,30.31 54.25,30.15 52.75,30.15 52.6,30.01 IC2.3
FLASH_VDD  (via drill 0.3)
  Top 0.127: IC3.26 54.99,33.88 54.65,34.22 50.28,34.22 50.06,34.44 IC2.8 50.06,36.23 v50.05,36.25 | C16.2 C17.2 52.78,27.38 v52.8,27.4
  Bottom 0.127: v52.8,27.4 52.64,27.56 49.83,27.56 49.51,27.88 49.51,35.71 v50.05,36.25
GND  (via drill 0.3, 0.35)
  Top 0.127: C11.1 C20.1 | C20.1 C12.1 C14.1 | C22.1 57.48,25.06 | 57.48,25.06 C23.1 | 57.48,25.06 59.45,25.06 60.12,25.73 L1.2 60.3,25.73 61.14,24.89 61.46,24.89 62.32,24.03 L1.4 62.44,24.02 63.42,24.02 63.63,23.81 v63.63,23.62 | R4.1 27.6,7.44 28.44,6.6 28.8,6.96 | 28.8,6.96 30.23,5.53 30.23,5.08 R10.1 | 34.29,27.81 32.64,27.81 C4.2 32.51,27.81 32.13,27.43 32.13,10.29 v29.59,7.75 28.8,6.96 | C8.2 38.05,31.04 36.92,32.17 35.14,32.17 34.8,32.51 | 34.8,32.51 34.26,31.97 IC1.2 34.29,30.61 34.29,27.81 | 34.29,27.81 C2.1 | 34.8,32.51 34.29,33.02 34.29,36.96 IC1.4 | C10.1 68.33,34.8 68.33,33.91 C15.1 68.34,33.84 69.16,33.84 v69.22,33.78 69.22,32.93 70.05,32.1 E1.GND | 60.07,32 60.07,31.11 v60.1,31.05 | 61.98,31.11 61.21,31.11 v61.1,31.05 | 61.98,31.11 v62.1,31.05 | 61.98,31.11 IC3.49 | 60.07,32 v60.1,32.05 | 60.07,32 IC3.49 | v61.1,32.05 61.09,32.13 IC3.49 | v62.1,32.05 61.98,32 61.72,32 61.47,31.75 IC3.49 | 61.09,33.15 60.2,33.15 v60.1,33.05 | 61.09,33.15 v61.1,33.05 61.21,33.15 61.98,33.15 v62.1,33.05 | 61.09,33.15 IC3.49 | v67.18,29.08 67.25,29.01 C20.1 | 50.93,32.51 50.93,31.62 v50.95,31.6 | 50.93,32.51 v50.95,32.6 | 50.93,32.51 IC2.9 | v51.95,31.6 51.94,31.62 51.94,32.13 IC2.9 | IC2.9 51.94,32.26 51.94,32.51 v51.95,32.6 52.07,32.64 52.83,32.64 v52.95,32.6 | v52.95,31.6 52.83,31.62 52.07,31.62 v51.95,31.6 | C13.2 40.09,25.37 40.01,25.45 40.01,27.58 40.42,28 41.8,28 43.04,26.76 45.38,26.76 46.92,25.22 Q4.2 48.51,25.22 49.1,24.64 52.7,24.64 C17.1 52.83,24.64 53.85,24.64 C16.1 53.98,24.64 54.48,25.15 54.48,27.68 53.88,28.29 IC2.4 53.88,28.58 53.64,28.33 52.33,28.33 52.07,28.59 52.07,31.5 v51.95,31.6
  Top 0.127: 24.38,1.52 Q3.2 24.33,2.25 24.74,2.66 25.27,2.66 26.23,3.63 R9.2 26.23,8.51 23.24,8.51 23.11,8.38 13.98,8.38 7.32,15.03 7.32,17.34 11.36,21.38 | C9.2 R1.2 C1.1 C3.1 C5.1 63.25,15.62 65.93,12.95 65.93,10.07 S1.1 65.91,10.16 69.22,10.16 69.6,10.54 JP2.3
  Top 2.54: J2.1 11.36,21.38 13.34,19.4 14.47,19.4 J1.1
  Bottom 0.127: DSP1.D24 39.7,4.5 | 39.7,4.5 35.51,4.5 DSP1.D30 35.43,7.75 v29.59,7.75 23.24,7.75 22.23,8.76 22.23,9.14 22.35,9.27 22.35,11.05 17.53,15.88 17.53,16.26 J1.1 | 39.7,4.5 40.41,4.5 | 40.41,4.5 DSP1.D23 | 40.41,4.5 41.8,4.5 | 41.8,4.5 DSP1.D21 | 41.8,4.5 43.2,4.5 | 43.2,4.5 DSP1.D19 | 43.2,4.5 43.91,4.5 | 43.91,4.5 DSP1.D18 | 43.91,4.5 45.3,4.5 | 45.3,4.5 DSP1.D16 | 45.3,4.5 46.01,4.5 | 46.01,4.5 DSP1.D15 | 46.01,4.5 46.7,4.5 | 46.7,4.5 DSP1.D14 | 46.7,4.5 49.51,4.5 | 49.51,4.5 DSP1.D10 | 49.51,4.5 50.2,4.5 | 50.2,4.5 DSP1.D9 | 50.2,4.5 50.91,4.5 | 50.91,4.5 DSP1.D8 | 50.91,4.5 51.6,4.5 | 51.6,4.5 DSP1.D7 | 51.6,4.5 52.3,4.5 | 52.3,4.5 DSP1.D6 | 52.3,4.5 55.1,4.5 | DSP1.D2 55.1,4.5 | 55.1,4.5 55.77,4.5 | 55.77,4.5 55.8,4.5 DSP1.D1 | 66.67,31.24 66.55,31.37 62.36,31.37 62.1,31.11 v62.1,31.05 | 66.67,31.24 67.18,30.73 v67.18,29.08 63.63,25.53 v63.63,23.62 63.63,17.14 69.6,11.18 69.6,10.67 JP2.3 69.72,10.54 73.41,6.86 73.41,5.73 74.68,4.46 74.68,4.06 JP1.3 74.71,2.8 74.46,2.55 71.42,2.55 69.47,4.5 55.77,4.5 | 66.67,31.24 v69.22,33.78 | v60.1,33.05 60.07,33.15 57.78,33.15 54.14,36.79 51.02,36.79 50.8,36.58 50.8,32.77 50.93,32.64 v50.95,32.6
  pour Top: 0,38.85 76.7,38.85 76.7,7.7 76.7,0 22.25,0 0,0 0,8.25
  pour Bottom: 0,38.85 76.7,38.85 76.7,7.15 76.7,0 73.4,0 0,0
N$1
  Top 0.406: C18.2 71.24,30.03 E1.ANT
N$2
  Top 0.127: R5.2 28.83,4.95 27.69,4.95 R6.2 27.61,6.09 27.05,6.65 27.05,11.05 28.57,12.57 29.84,12.57 30.1,12.83 30.1,19.81 29.31,20.6 22.87,20.6 21.35,22.13 21.35,24.12 24.34,27.12 Q2.1
N$3
  Top 2.54: J2.2 17.49,29.4 19.39,31.3 23.5,31.3 26.63,34.43 Q2.2
N$5
  Top 0.127: Q3.3 26.43,3.4 27,3.96 R6.1
N$6
  Top 0.127: R9.1 24.18,7.88 23.88,7.57 23.88,6.22 R11.2 24.38,5.65 24.38,3.43 Q3.1
N$7
  Top 0.127: R16.1 70.23,14.31 71.78,14.31 72.76,13.34 74.63,13.34 74.8,13.51 74.8,14.73 LED1.1
N$8
  Top 0.127: R18.1 70.23,15.37 70.74,15.37 71.25,14.86 73.03,14.86 LED1.2
N$9  (via drill 0.3)
  Top 0.127: v71.5,15.49 71.5,15.86 70.88,16.48 R17.1 | v73.41,13.97 73.72,13.97 74.01,14.26 74.01,15.17 74.82,15.98 LED1.4
  Bottom 0.127: v71.5,15.49 72.35,15.49 73.41,14.44 v73.41,13.97
N$10
  Top 2.54: Q1.2 23.57,13.21 19.55,13.21 19.19,12.85 12.65,12.85 10.29,15.21 J1.2
N$15
  Top 0.127: D1.2 28.62,10.33 R4.2
  Top 0.508: D1.2 30.23,10.38 30.65,10.8 30.65,20.45 28.92,22.18 Q1.1
N$23
  Top 0.127: 65.04,30.28 IC3.2
  Top 0.406: C18.1 66.12,30.03 65.87,30.28 65.04,30.28
N$24
  Top 0.127: IC3.48 63.28,26.96 64.08,26.16 64.64,26.16 R15.2 | C21.1 R15.2 | R15.2 C20.2
N$25
  Top 0.127: IC3.47 62.88,26.94 64.13,25.69 R15.1 C21.2
N$26
  Top 0.127: L1.3 59,24.03 C23.2 57.98,24.02 57.12,24.02 56.97,24.17 56.97,26 57.12,26.15 58.61,26.15 59.35,26.89 59.58,26.89 59.59,26.89 60.72,26.89 60.99,27.16 61.55,27.16 61.87,27.47 61.87,27.92 61.68,28.12 IC3.44
N$27
  Top 0.127: C22.2 58.5,25.68 59.45,26.63 59.48,26.63 60.83,26.63 61.1,26.9 61.42,26.9 | 62.29,25.73 L1.1 62.32,25.73 61.42,26.63 61.42,26.9 | IC3.45 62.08,28.07 62.13,28.03 62.13,27.37 61.66,26.9 61.42,26.9
N$28  (via drill 0.3)
  Top 0.127: v34.92,11.94 34.88,11.98 34.88,24.13 34.89,24.14 C7.1
  Bottom 0.127: 37.59,7.75 DSP1.D27 37.6,9.76 36.22,11.14 35.72,11.14 v34.92,11.93 v34.92,11.94
N$30  (via drill 0.3)
  Top 0.127: R7.1 C9.1 54.14,19.98 v54.1,19.94
  Bottom 0.127: DSP1.D17 44.6,10.4 | DSP1.D20 42.51,10.4 44.58,10.4 44.6,10.4 | 44.6,10.4 44.62,10.4 54.1,19.89 v54.1,19.94
N$31  (via drill 0.3)
  Top 0.127: v53.98,10.79 58.89,15.71 58.89,16.77 59.91,17.8 C1.2
  Bottom 0.127: v53.98,10.79 53.98,10.76 53.72,10.49 53.72,7.75 DSP1.D4
N$32  (via drill 0.3)
  Top 0.127: v35.94,11.68 35.9,11.72 35.9,24.12 35.91,24.11 C7.2
  Bottom 0.127: v35.94,11.68 36.87,11.68 38.31,10.24 DSP1.D26
N$33  (via drill 0.3)
  Top 0.127: C3.2 C5.2 60.43,15.61 60.07,15.26 v60.07,14.99
  Bottom 0.127: v60.07,14.99 59.85,14.99 54.4,9.53 DSP1.D3
N$34  (via drill 0.3)
  Top 0.127: v53.21,11.05 53.21,12.99 59.1,18.88 R1.1
  Bottom 0.127: v53.21,11.05 53.21,11 53.01,10.8 DSP1.D5
N$35  (via drill 0.3)
  Top 0.127: v32.77,12.57 32.77,24.13 C6.1
  Bottom 0.127: 36.2,7.75 DSP1.D29 36.2,9.9 35.2,10.91 33.44,10.91 32.77,11.58 v32.77,12.57
N$36  (via drill 0.3)
  Top 0.127: v33.78,12.45 33.78,24.13 C6.2
  Bottom 0.127: 36.83,7.75 36.87,7.71 36.89,7.69 | 36.89,7.69 DSP1.D28 | v33.78,12.45 33.78,11.41 34.03,11.16 35.32,11.16 36.89,9.59 36.89,7.69
N$39
  Top 0.127: IC3.7 64.83,32.29 65.37,31.75 67.31,31.75 C19.2
N$66
  Top 0.127: D2.2 43.69,27.56 46.48,27.56 Q4.3 46.61,27.69 46.61,30.35 LS1.N
N$69
  Top 0.127: R12.2 43.6,26.5 44.88,25.22 Q4.1
RESET  (via drill 0.3)
  Top 0.127: IC3.9 65.03,33.08 65.71,32.4 65.97,32.4 v66.12,32.55 | v64.52,17.25 64.85,17.58 v66.06,17.58 | v65.77,19.23 66.83,19.23 67.05,19.45 R13.1
  Bottom 0.127: v66.12,32.55 67.9,34.33 69.44,34.33 69.76,34.01 69.76,31.33 67.99,29.56 67.99,28.94 64.17,25.12 64.17,23.4 63.96,23.19 63.96,17.81 v64.52,17.25 | v66.06,17.58 66.06,18.94 v65.77,19.23
U0RXD  (via drill 0.3)
  Top 0.127: v64.9,20.95 62.99,22.86 59.23,22.86 58.85,23.24 57.53,23.24 56.64,24.13 56.64,26.04 57.02,26.42 58.02,26.42 60.08,28.48 IC3.40
  Bottom 0.127: v64.9,20.95 73.66,12.19 73.66,7.62 74.68,6.6 JP1.4
U0TXD  (via drill 0.3)
  Top 0.127: v51.94,18.92 51.94,11.05 56.39,6.6 72.14,6.6 JP1.2 | 60.45,29.08 IC3.41 60.48,28.19 59.81,27.52 v59.81,27.43
  Bottom 0.127: v59.81,27.43 59.81,26.79 v51.94,18.92
VCC  (via drill 0.3)
  Top 0.127: R5.1 28.92,2.05 29.36,1.6 R8.2 31.09,1.6 32,2.51 v32,8.38
  Top 0.305: IC1.1 31.96,28.2 C4.1 28.94,27.86 Q2.3
  Top 0.508: D1.1 24.23,10.38 v22.85,9 | v22.3,22.85 24.32,22.85 Q1.3
  Top 2.54: Q1.3 24.34,23.31 Q2.3
  Bottom 0.127: v32,8.38 23.5,8.38 22.99,8.89 v22.85,9
  Bottom 0.508: v22.85,9 22.85,22.3 v22.3,22.85

### Text on the board
tPlace: OUTPUT 15A | INPUT | SELECT | BOOT | TX RX | 3V3 G
bPlace: Output: + - | Data: / -15A eq. 400W MAX / -26V MAX input eq. 6S Li-Po | BDC | V2 | Dev. by Marvin Ramm | Input: - +